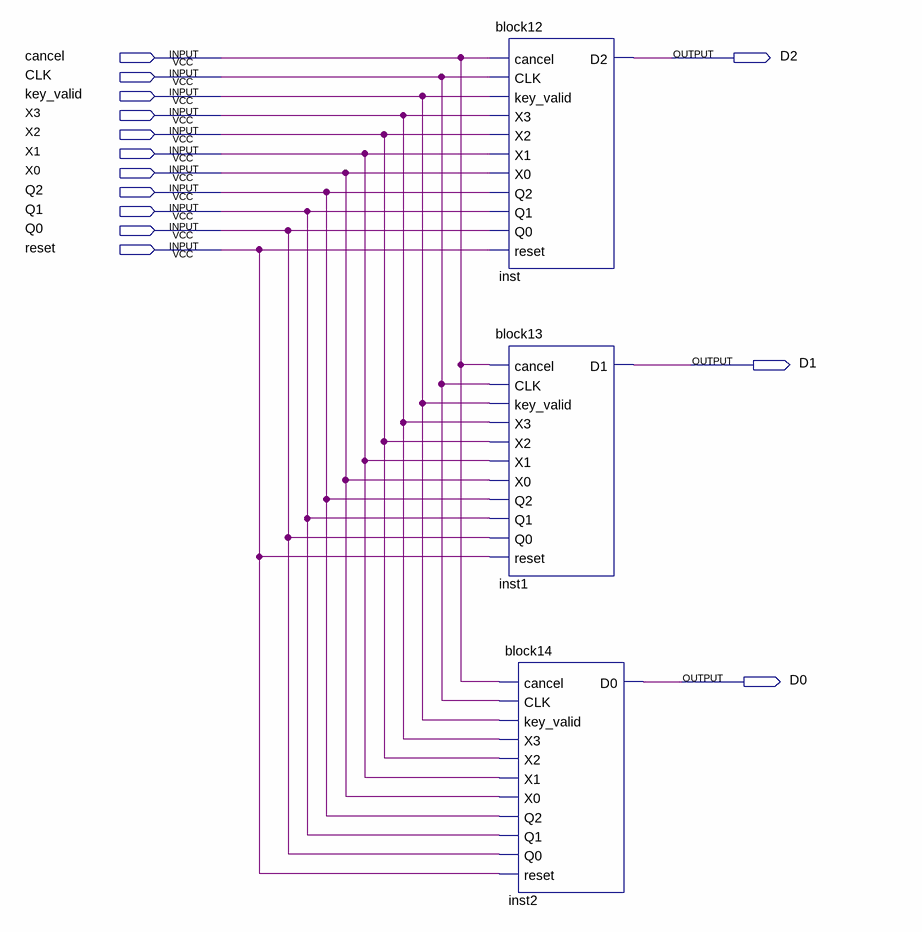
[diagram p0: schematic sheet]
// Quartus schematic block15.bdf as structural Verilog: 3 symbols, 14 pins
module block15 (
  input  cancel,
  input  CLK,
  input  key_valid,
  input  X3,
  input  X2,
  input  X1,
  input  X0,
  input  Q2,
  input  Q1,
  input  Q0,
  input  reset,
  output D2,
  output D1,
  output D0
);

  block12 inst (
    .cancel(cancel), .CLK(CLK), .key_valid(key_valid), .X3(X3), .X2(X2), .X1(X1), .X0(X0), .Q2(Q2), .Q1(Q1),
    .Q0(Q0), .reset(reset), .D2(D2));
  block13 inst1 (
    .cancel(cancel), .CLK(CLK), .key_valid(key_valid), .X3(X3), .X2(X2), .X1(X1), .X0(X0), .Q2(Q2), .Q1(Q1),
    .Q0(Q0), .reset(reset), .D1(D1));
  block14 inst2 (
    .cancel(cancel), .CLK(CLK), .key_valid(key_valid), .X3(X3), .X2(X2), .X1(X1), .X0(X0), .Q2(Q2), .Q1(Q1),
    .Q0(Q0), .reset(reset), .D0(D0));
endmodule
